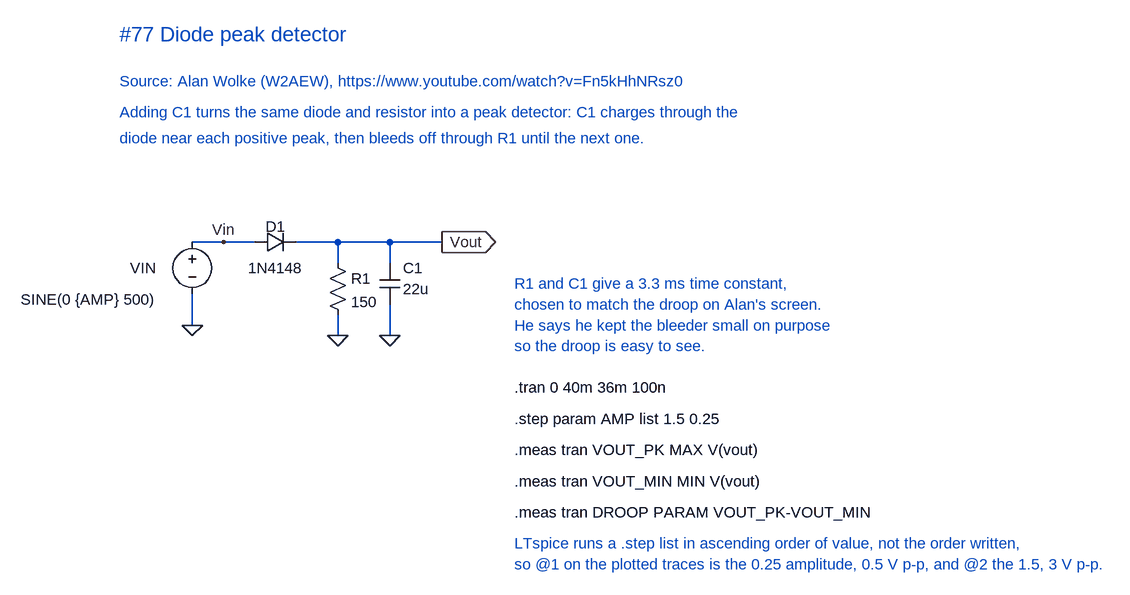
[diagram p0: schematic Diode peak detector.asc]
Diode peak detector.asc, the LTspice schematic file:
Version 4.1
SHEET 1 1100 700
WIRE 160 32 64 32
WIRE 288 32 224 32
WIRE 368 32 288 32
WIRE 448 32 368 32
WIRE 64 160 64 112
WIRE 288 64 288 32
WIRE 288 176 288 144
WIRE 368 64 368 32
WIRE 368 176 368 128
FLAG 64 160 0
FLAG 288 176 0
FLAG 368 176 0
FLAG 448 32 Vout
IOPIN 448 32 Out
FLAG 112 32 Vin
SYMBOL voltage 64 16 R0
WINDOW 123 0 0 Left 0
WINDOW 39 0 0 Left 0
WINDOW 0 -56 56 Right 2
WINDOW 3 -264 104 Left 2
SYMATTR InstName VIN
SYMATTR Value SINE(0 {AMP} 500)
SYMBOL diode 160 48 R270
WINDOW 0 24 32 VTop 2
WINDOW 3 -8 32 VBottom 2
SYMATTR InstName D1
SYMATTR Value 1N4148
SYMBOL res 272 48 R0
SYMATTR InstName R1
SYMATTR Value 150
SYMBOL cap 352 64 R0
WINDOW 0 36 8 Left 2
WINDOW 3 36 40 Left 2
SYMATTR InstName C1
SYMATTR Value 22u
TEXT -48 -288 Left 3 ;#77 Diode peak detector
TEXT -48 -216 Left 2 ;Source: Alan Wolke (W2AEW), https://www.youtube.com/watch?v=Fn5kHhNRsz0
TEXT -48 -168 Left 2 ;Adding C1 turns the same diode and resistor into a peak detector: C1 charges through the
TEXT -48 -128 Left 2 ;diode near each positive peak, then bleeds off through R1 until the next one.
TEXT 560 96 Left 2 ;R1 and C1 give a 3.3 ms time constant,
TEXT 560 128 Left 2 ;chosen to match the droop on Alan's screen.
TEXT 560 160 Left 2 ;He says he kept the bleeder small on purpose
TEXT 560 192 Left 2 ;so the droop is easy to see.
TEXT 560 256 Left 2 !.tran 0 40m 36m 100n
TEXT 560 304 Left 2 !.step param AMP list 1.5 0.25
TEXT 560 352 Left 2 !.meas tran VOUT_PK MAX V(vout)
TEXT 560 400 Left 2 !.meas tran VOUT_MIN MIN V(vout)
TEXT 560 448 Left 2 !.meas tran DROOP PARAM VOUT_PK-VOUT_MIN
TEXT 560 496 Left 2 ;LTspice runs a .step list in ascending order of value, not the order written,
TEXT 560 528 Left 2 ;so @1 on the plotted traces is the 0.25 amplitude, 0.5 V p-p, and @2 the 1.5, 3 V p-p.

The netlist it stands for:
* Diode peak detector.asc
VIN Vin 0 SINE(0 {AMP} 500)
D1 Vin Vout 1N4148
R1 Vout 0 150
C1 Vout 0 22u
.model D D
.lib standard.dio
* #77 Diode peak detector
* Source: Alan Wolke (W2AEW), https://www.youtube.com/watch?v=Fn5kHhNRsz0
* Adding C1 turns the same diode and resistor into a peak detector: C1 charges through the
* diode near each positive peak, then bleeds off through R1 until the next one.
* R1 and C1 give a 3.3 ms time constant,
* chosen to match the droop on Alan's screen.
* He says he kept the bleeder small on purpose
* so the droop is easy to see.
.tran 0 40m 36m 100n
.step param AMP list 1.5 0.25
.meas tran VOUT_PK MAX V(vout)
.meas tran VOUT_MIN MIN V(vout)
.meas tran DROOP PARAM VOUT_PK-VOUT_MIN
* LTspice runs a .step list in ascending order of value, not the order written,
* so @1 on the plotted traces is the 0.25 amplitude, 0.5 V p-p, and @2 the 1.5, 3 V p-p.
.backanno
.end